# Altium schematic sheet Power_Section.SchDoc
size A4; DocumentNumber: 3; SheetNumber: 3; SheetTotal: 9
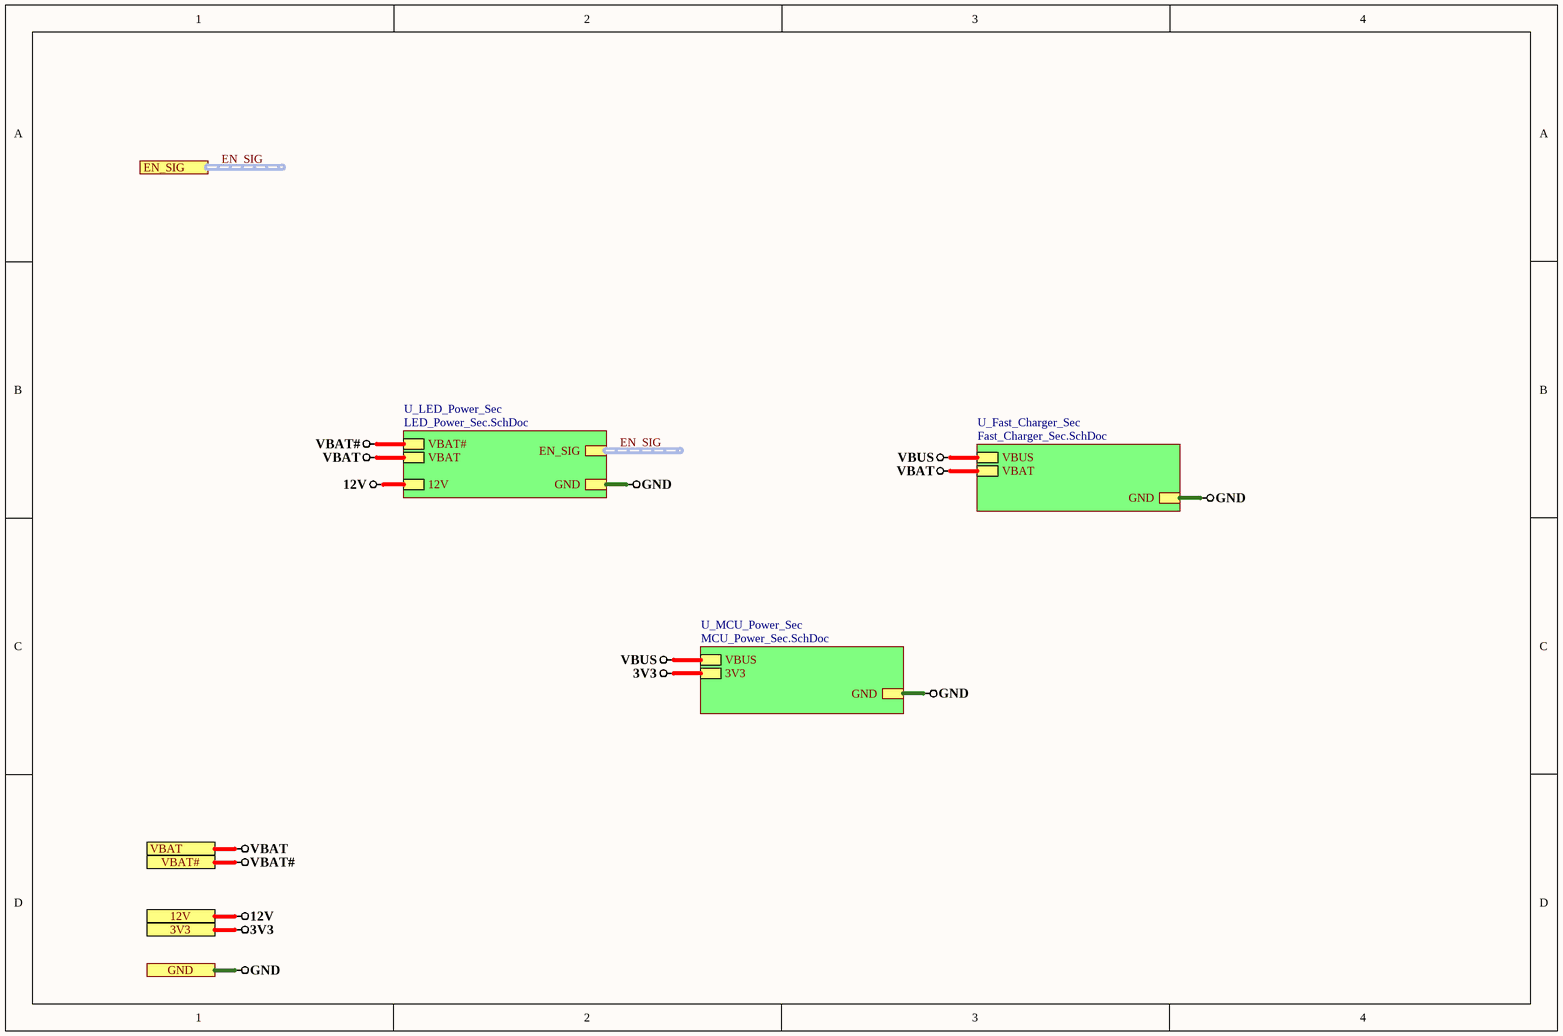
[diagram p0: Power_Section.SchDoc]

## Sub-sheets
U_Fast_Charger_Sec = Fast_Charger_Sec.SchDoc: GND, VBAT, VBUS
U_LED_Power_Sec = LED_Power_Sec.SchDoc: VBAT#, GND, VBAT, 12V, EN_SIG (harness EN_SIG)
U_MCU_Power_Sec = MCU_Power_Sec.SchDoc: VBUS, GND, 3V3

## Ports
3V3, 12V, EN_SIG (harness EN_SIG), GND, VBAT, VBAT#

## Nets
3V3: port 3V3, sheet U_MCU_Power_Sec/3V3
12V: port 12V, sheet U_LED_Power_Sec/12V
GND: port GND, sheet U_MCU_Power_Sec/GND, sheet U_LED_Power_Sec/GND, sheet U_Fast_Charger_Sec/GND
VBAT: port VBAT, sheet U_LED_Power_Sec/VBAT, sheet U_Fast_Charger_Sec/VBAT
VBAT#: port VBAT#, sheet U_LED_Power_Sec/VBAT#
VBUS: sheet U_MCU_Power_Sec/VBUS, sheet U_Fast_Charger_Sec/VBUS

## Buses and harness runs
harness EN_SIG = port EN_SIG
harness EN_SIG = sheet U_LED_Power_Sec/EN_SIG